# Altium project GR_carte_action27.PrjPcb
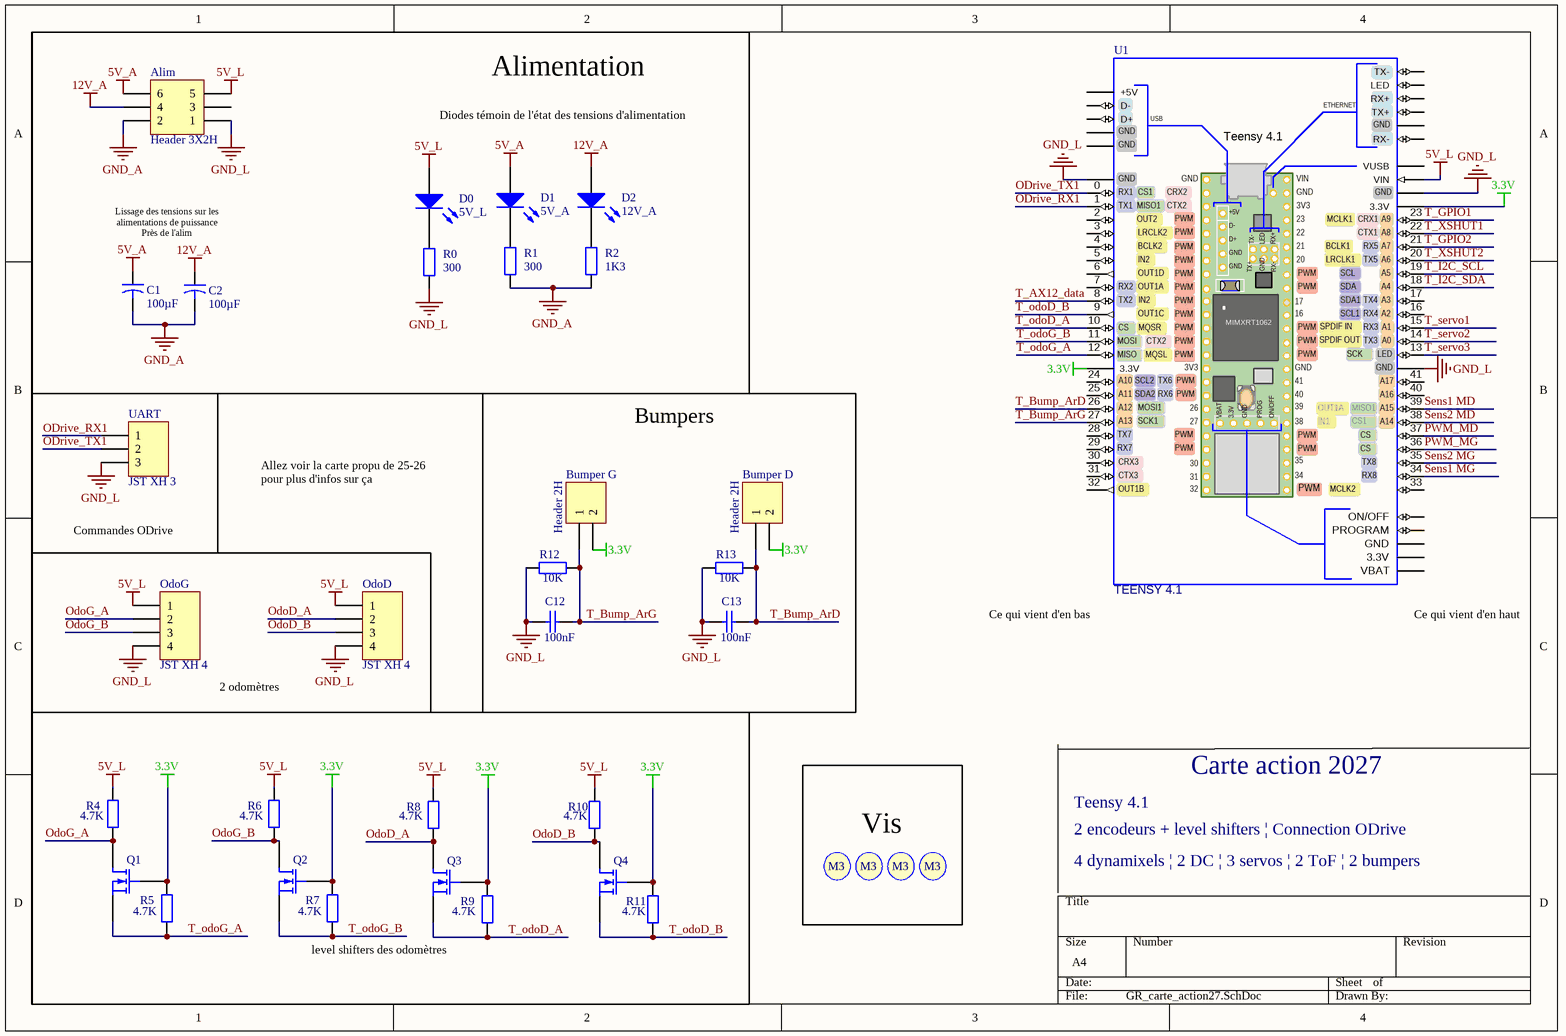
[diagram p0: GR_carte_action27.SchDoc]
2 sheets, 55 parts. Net scope: global (net labels, ports and power ports of the same name join across sheets).
Board files: GR_carte_action27.PcbDoc, GR_carte_action27v2.PcbDoc
Sheets:
  GR_carte_action27.SchDoc
  GR_carte_action_actionneurs27.SchDoc

## Sheet GR_carte_action27.SchDoc
size A4; SheetNumber: 1; SheetTotal: 2

### Parts
Alim  Header 3X2H  [MOLEX_MINIFITJR_3X2]
Bumper_D  Header 2H  [S2B-XH-A]
Bumper_G  Header 2H  [S2B-XH-A]
C1  value 100µF  [Condensateur]  (hidden comment: Cap2)
C2  value 100µF  [Condensateur]  (hidden comment: Cap2)
C12  value 100nF  [Capacitor 1206]  (hidden comment: Cap)
C13  value 100nF  [Capacitor 1206]  (hidden comment: Cap)
D0  5V_L  [KP-3216SEC]
D1  5V_A  [KP-3216SEC]
D2  12V_A  [KP-3216SEC]
OdoD  JST XH 4  [S4B-XH-A]
OdoG  JST XH 4  [S4B-XH-A]
Q1  MOSFET-N  [SOT23_M]  (value not drawn)
Q2  MOSFET-N  [SOT23_M]  (value not drawn)
Q3  MOSFET-N  [SOT23_M]  (value not drawn)
Q4  MOSFET-N  [SOT23_M]  (value not drawn)
R0  value 300  [Resistor 1206]  (hidden comment: Res2)
R1  value 300  [Resistor 1206]  (hidden comment: Res2)
R2  value 1K3  [Resistor 1206]  (hidden comment: Res2)
R4  value 4.7K  [Resistor 1206]  (hidden comment: Res2)
R5  value 4.7K  [Resistor 1206]  (hidden comment: Res2)
R6  value 4.7K  [Resistor 1206]  (hidden comment: Res2)
R7  value 4.7K  [Resistor 1206]  (hidden comment: Res2)
R8  value 4.7K  [Resistor 1206]  (hidden comment: Res2)
R9  value 4.7K  [Resistor 1206]  (hidden comment: Res2)
R10  value 4.7K  [Resistor 1206]  (hidden comment: Res2)
R11  value 4.7K  [Resistor 1206]  (hidden comment: Res2)
R12  value 10K  [Resistor 1206]  (hidden comment: Res2)
R13  value 10K  [Resistor 1206]  (hidden comment: Res2)
S0  Screw M3  [Screw M3]  (value not drawn)
S1  Screw M3  [Screw M3]  (value not drawn)
S2  Screw M3  [Screw M3]  (value not drawn)
S3  Screw M3  [Screw M3]  (value not drawn)
U1  value TEENSY 4.1  [Teensy_4.1]  (hidden comment: TEENSY_4.1)
UART  JST XH 3  [S3B-XH-A]

### Nets
3.3V: Bumper_D.2 Bumper_G.2 Q1.2(G) Q2.2(G) Q3.2(G) Q4.2(G) R5.2 R7.2 R9.2 R11.2 U1.3.3V_1(3.3V) U1.3.3V_2(3.3V)
5V_A: Alim.6 C1.1 D1.1(A)
5V_L: Alim.5 D0.1(A) OdoD.1 OdoG.1 R4.2 R6.2 R8.2 R10.2 U1.VIN
12V_A: Alim.4 C2.1 D2.1(A)
GND_A: Alim.2 C1.2 C2.2 R1.2 R2.2
GND_L: Alim.1 C12.1 C13.1 OdoD.4 OdoG.4 R0.1 R12.1 R13.1 U1.GND1(GND) U1.GND2(GND) U1.GND3(GND) UART.3
OdoD_A: OdoD.2 Q3.1(D) R8.1
OdoD_B: OdoD.3 Q4.1(D) R10.1
OdoG_A: OdoG.2 Q1.1(D) R4.1
OdoG_B: OdoG.3 Q2.1(D) R6.1
ODrive_RX1: U1.1(TX1) UART.1
ODrive_TX1: U1.0(RX1) UART.2
PWM_MD: U1.37(CS3)
PWM_MG: U1.36(CS2)
Sens1 MD: U1.39(A15)
Sens1 MG: U1.34(RX8)
Sens2 MD: U1.38(A14)
Sens2 MG: U1.35(TX8)
T_AX12_data: U1.8(TX2)
T_Bump_ArD: Bumper_D.1 C13.2 R13.2 U1.26(A12)
T_Bump_ArG: Bumper_G.1 C12.2 R12.2 U1.27(A13)
T_GPIO1: U1.23(A9)
T_GPIO2: U1.21(A7)
T_I2C_SCL: U1.19(A5)
T_I2C_SDA: U1.18(A4)
T_odoD_A: Q3.3(S) R9.1 U1.10(CS1)
T_odoD_B: Q4.3(S) R11.1 U1.9(OUT1C)
T_odoG_A: Q1.3(S) R5.1 U1.12(MISO)
T_odoG_B: Q2.3(S) R7.1 U1.11(MOSI)
T_servo1: U1.15(A1)
T_servo2: U1.14(A0)
T_servo3: U1.13(SCK)
T_XSHUT1: U1.22(A8)
T_XSHUT2: U1.20(A6)
NetD0_2: D0.2(K) R0.2
NetD1_2: D1.2(K) R1.1
NetD2_2: D2.2(K) R2.1

Not connected (* = marked no-connect by the designer): Alim 3; U1 2(OUT2) 3(LRCLK2) 3.3V_3(3.3V) 4(BCLK2) 5(IN2) 5V(+5V) 6(OUT1D) 7(RX2) 16(A2) 17(A3) 24(A10) 25(A11) 28(RX7) 29(TX7) 30(CRX3) 31(CTX3) 32(OUT1B) 33(MCLK2) 40(A16) 41(A17) D+ D- GND4(GND) GND5(GND) LED ON/OFF PROGRAM RX+ RX- TX+ TX- USB_GND1(USB_GND) USB_GND2(USB_GND) VBAT VUSB

### Notes on the sheet
- Alimentation
- Diodes témoin de l'état des tensions d'alimentation
- Lissage des tensions sur les alimentations de puissance
  Près de l'alim
- Bumpers
- Allez voir la carte propu de 25-26 pour plus d'infos sur ça
- Commandes ODrive
- (near U1) Ce qui vient d'en bas
- (near U1) Ce qui vient d'en haut
- 2 odomètres
- Carte action 2027
- Vis
- Teensy 4.1
- 2 encodeurs + level shifters | Connection ODrive
- 4 dynamixels | 2 DC | 3 servos | 2 ToF | 2 bumpers
- (near R7) level shifters des odomètres
- (in symbol Screw M3) M3
- (in symbol TEENSY_4.1) ETHERNET; USB; Teensy 4.1; CRX2; MISO1; CTX2; 3V3; PWM; MCLK1; CRX1; CTX1; BCLK1; RX5; LRCLK1; TX5; SCL; OUT1A; SDA; SDA1; TX4; SCL1; RX4; MIMXRT1062; CS; MQSR; SPDIF IN; RX3; SPDIF OUT; TX3; MQSL; SCL2; TX6; SDA2; RX6; MOSI1; PROG; SCK1; IN1

### Library data of the parts
Alim = Header 3X2H: Header, 3-Pin, Dual row, Right Angle; LatestRevisionDate: 17-Jul-2002; LatestRevisionNote: Re-released for DXP Platform.; Publisher: Altium Limited
Bumper_D Bumper_G = Header 2H: Header, 2-Pin, Right Angle; LatestRevisionDate: 17-Jul-2002; LatestRevisionNote: Re-released for DXP Platform.; Publisher: Altium Limited
C1 C2 = Cap2: Capacitor; Published: 23-Sep-2002; PackageReference: CAPR5-4X5; Publisher: Altium Limited; PackageDescription: Capacitor; 2 Leads
C12 C13 = Cap: Capacitor; Published: 8-Jun-2000; LatestRevisionDate: 17-Jul-2002; LatestRevisionNote: Re-released for DXP Platform.; PackageReference: RAD-0.3; Publisher: Altium Limited; PackageDescription: Radial Cap, Thru-Hole; 2 Leads; 0.3 in Pin Spacing
D0-D2 = LED2: Typical RED, GREEN, YELLOW, AMBER GaAs LED; Published: 8-Jun-2000; LatestRevisionDate: 17-Jul-2002; LatestRevisionNote: Re-released for DXP Platform.; PackageVersion: Feb-2002; PackageReference: 3.2X1.6X1.1; Publisher: Altium Limited; PackageDescription: SM LED; 2 Flat Leads
OdoD OdoG = Header 4H: Molex SPOX 4x1H; LatestRevisionDate: 17-Jul-2002; LatestRevisionNote: Re-released for DXP Platform.; Publisher: Altium Limited
Q1-Q4 = MOSFET-N: N-Channel MOSFET; pin to pad: 2>3 3>2; Published: 8-Jun-2000; LatestRevisionDate: 17-Jul-2002; LatestRevisionNote: Re-released for DXP Platform.; PackageVersion: 1995/1996; PackageReference: E3; Publisher: Altium Limited; PackageDescription: TO, Flat Index; 3 In-Line, Axial Leads; Body Dia. 4.6mm; Lead Dia. 0.5 mm (max)
R0-R2 R4-R13 = Res2: Resistor; Published: 8-Jun-2000; LatestRevisionDate: 17-Jul-2002; LatestRevisionNote: Re-released for DXP Platform.; PackageReference: AXIAL-0.4; Publisher: Altium Limited; PackageDescription: Axial Device, Thru-Hole; 2 Leads; 0.4 in Pin Spacing
U1 = TEENSY_4.1: RT1062 Teensy 4.1 w/ Headers RT1062 600 MHZ; Manufacturer: PJRC; Manufacturer_Part_Number: DEV-16996; ComponentLink1Description: pin_function_front; ComponentLink1URL: https://www.pjrc.com/teensy/card11a_rev4_web.pdf; ComponentLink2Description: pin_function_back; ComponentLink2URL: https://www.pjrc.com/teensy/card11b_rev4_web.pdf; ComponentLink3Description: Digikey; ComponentLink3URL: https://www.digikey.com/en/products/detail/sparkfun-electronics/16996/13158152; ComponentLink4Description: Datasheet; ComponentLink4URL: https://mm.digikey.com/Volume0/opasdata/d220001/medias/docus/2942/DEV-16996_Web.pdf
UART = Header 3H: Header, 3-Pin, Right Angle; LatestRevisionDate: 17-Jul-2002; LatestRevisionNote: Re-released for DXP Platform.; Publisher: Altium Limited

## Sheet GR_carte_action_actionneurs27.SchDoc
size A4; SheetNumber: 2; SheetTotal: 2
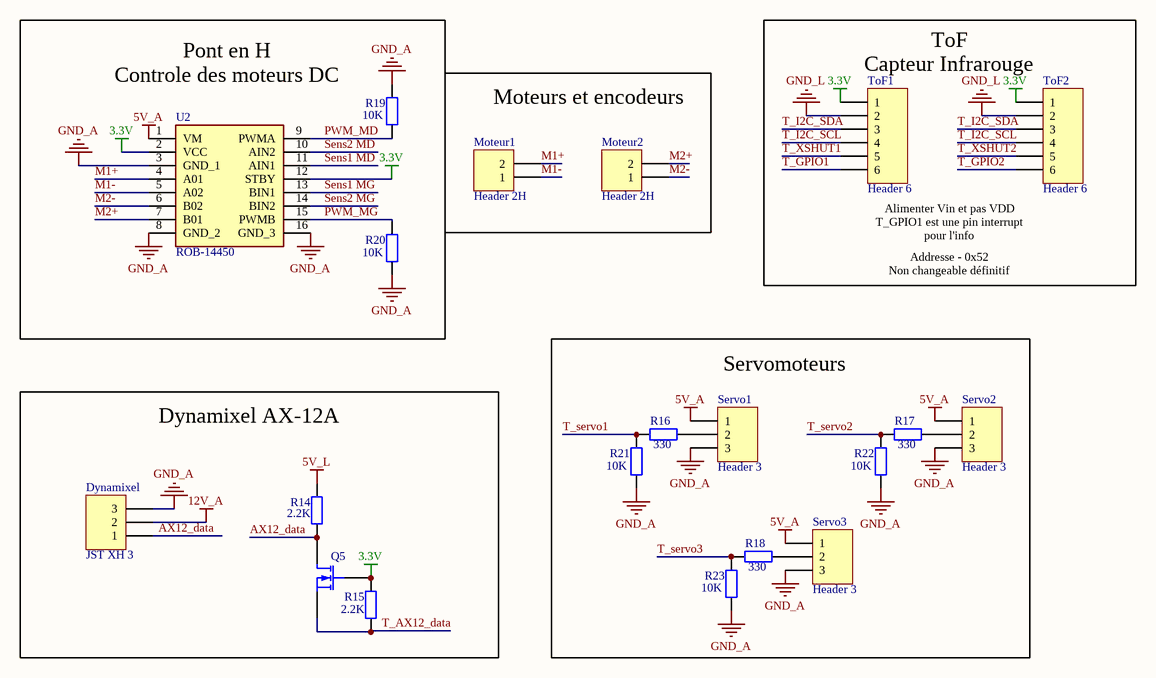
[diagram p1: GR_carte_action_actionneurs27.SchDoc]

### Parts
Dynamixel  JST XH 3  [S3B-XH-A]
Moteur1  Header 2H  [JST XH B2B-XH-A]
Moteur2  Header 2H  [JST XH B2B-XH-A]
Q5  MOSFET-N  [SOT23_M]  (value not drawn)
R14  value 2.2K  [Resistor 1206]  (hidden comment: Res2)
R15  value 2.2K  [Resistor 1206]  (hidden comment: Res2)
R16  value 330  [Resistor 1206]  (hidden comment: Res2)
R17  value 330  [Resistor 1206]  (hidden comment: Res2)
R18  value 330  [Resistor 1206]  (hidden comment: Res2)
R19  value 10K  [Resistor 1206]  (hidden comment: Res2)
R20  value 10K  [Resistor 1206]  (hidden comment: Res2)
R21  value 10K  [Resistor 1206]  (hidden comment: Res2)
R22  value 10K  [Resistor 1206]  (hidden comment: Res2)
R23  value 10K  [Resistor 1206]  (hidden comment: Res2)
Servo1  Header 3  [JST XH B3B-XH-A]
Servo2  Header 3  [JST XH B3B-XH-A]
Servo3  Header 3  [JST XH B3B-XH-A]
ToF1  Header 6  [JST XH B6B-XH-A]
ToF2  Header 6  [JST XH B6B-XH-A]
U2  ROB-14450  [ROB14450]

### Blocks framed on the sheet
Moteurs et encodeurs: Moteur1 Moteur2
Dynamixel AX-12A: Dynamixel Q5 R14 R15

### Nets
3.3V: Q5.2(G) R15.2 ToF1.1 ToF2.1 U2.2(VCC) U2.12(STBY)
5V_A: Servo1.1 Servo2.1 Servo3.1 U2.1(VM)
5V_L: R14.2
12V_A: Dynamixel.2
GND_A: Dynamixel.3 R19.2 R20.1 R21.1 R22.1 R23.1 Servo1.3 Servo2.3 Servo3.3 U2.3(GND_1) U2.8(GND_2) U2.16(GND_3)
GND_L: ToF1.2 ToF2.2
AX12_data: Dynamixel.1 Q5.1(D) R14.1
M1+: Moteur1.2 U2.4(A01)
M1-: Moteur1.1 U2.5(A02)
M2+: Moteur2.2 U2.7(B01)
M2-: Moteur2.1 U2.6(B02)
PWM_MD: R19.1 U2.9(PWMA)
PWM_MG: R20.2 U2.15(PWMB)
Sens1 MD: U2.11(AIN1)
Sens1 MG: U2.13(BIN1)
Sens2 MD: U2.10(AIN2)
Sens2 MG: U2.14(BIN2)
T_AX12_data: Q5.3(S) R15.1
T_GPIO1: ToF1.6
T_GPIO2: ToF2.6
T_I2C_SCL: ToF1.4 ToF2.4
T_I2C_SDA: ToF1.3 ToF2.3
T_servo1: R16.1 R21.2
T_servo2: R17.1 R22.2
T_servo3: R18.1 R23.2
T_XSHUT1: ToF1.5
T_XSHUT2: ToF2.5
NetR16_2: R16.2 Servo1.2
NetR17_2: R17.2 Servo2.2
NetR18_2: R18.2 Servo3.2

### Notes on the sheet
- Pont en H
  Controle des moteurs DC
- ToF
  Capteur Infrarouge
- Alimenter Vin et pas VDD
  T_GPIO1 est une pin interrupt pour l'info
- Addresse - 0x52
  Non changeable définitif
- Servomoteurs

### Library data of the parts
Dynamixel = Header 3H: Header, 3-Pin, Right Angle; LatestRevisionDate: 17-Jul-2002; LatestRevisionNote: Re-released for DXP Platform.; Publisher: Altium Limited
Moteur1 Moteur2 = Header 2H: Header, 2-Pin, Right Angle; LatestRevisionDate: 17-Jul-2002; LatestRevisionNote: Re-released for DXP Platform.; Publisher: Altium Limited
Q5 = MOSFET-N: N-Channel MOSFET; pin to pad: 2>3 3>2; Published: 8-Jun-2000; LatestRevisionDate: 17-Jul-2002; LatestRevisionNote: Re-released for DXP Platform.; PackageVersion: 1995/1996; PackageReference: E3; Publisher: Altium Limited; PackageDescription: TO, Flat Index; 3 In-Line, Axial Leads; Body Dia. 4.6mm; Lead Dia. 0.5 mm (max)
R14-R23 = Res2: Resistor; Published: 8-Jun-2000; LatestRevisionDate: 17-Jul-2002; LatestRevisionNote: Re-released for DXP Platform.; PackageReference: AXIAL-0.4; Publisher: Altium Limited; PackageDescription: Axial Device, Thru-Hole; 2 Leads; 0.4 in Pin Spacing
Servo1-Servo3 = Header 3: Header, 3-Pin; LatestRevisionDate: 17-Jul-2002; LatestRevisionNote: Re-released for DXP Platform.; Publisher: Altium Limited
ToF1 ToF2 = Header 6: Header, 6-Pin; LatestRevisionDate: 17-Jul-2002; LatestRevisionNote: Re-released for DXP Platform.; Publisher: Altium Limited
U2 = ROB-14450: Undefined or Miscellaneous; Manufacturer_Name: SparkFun; Datasheet Link: https://www.sparkfun.com/products/14450; Height: 5mm; Manufacturer_Part_Number: ROB-14450; Mouser Part Number: 474-ROB-14450; Mouser Price/Stock: https://www.mouser.co.uk/ProductDetail/SparkFun/ROB-14450?qs=wd5RIQLrsJhQdlH%2FW5H2aQ%3D%3D; Arrow Part Number: ROB-14450; Arrow Price/Stock: https://www.arrow.com/en/products/rob-14450/sparkfun-electronics?region=nac

## Nets that join several sheets
3.3V: GR_carte_action27 (12 pins), GR_carte_action_actionneurs27 (6 pins)
5V_A: GR_carte_action27 (Alim.6 C1.1 D1.1), GR_carte_action_actionneurs27 (Servo1.1 Servo2.1 Servo3.1 U2.1)
5V_L: GR_carte_action27 (9 pins), GR_carte_action_actionneurs27 (R14.2)
12V_A: GR_carte_action27 (Alim.4 C2.1 D2.1), GR_carte_action_actionneurs27 (Dynamixel.2)
GND_A: GR_carte_action27 (5 pins), GR_carte_action_actionneurs27 (12 pins)
GND_L: GR_carte_action27 (12 pins), GR_carte_action_actionneurs27 (ToF1.2 ToF2.2)
PWM_MD: GR_carte_action27 (U1.37), GR_carte_action_actionneurs27 (R19.1 U2.9)
PWM_MG: GR_carte_action27 (U1.36), GR_carte_action_actionneurs27 (R20.2 U2.15)
Sens1 MD: GR_carte_action27 (U1.39), GR_carte_action_actionneurs27 (U2.11)
Sens1 MG: GR_carte_action27 (U1.34), GR_carte_action_actionneurs27 (U2.13)
Sens2 MD: GR_carte_action27 (U1.38), GR_carte_action_actionneurs27 (U2.10)
Sens2 MG: GR_carte_action27 (U1.35), GR_carte_action_actionneurs27 (U2.14)
T_AX12_data: GR_carte_action27 (U1.8), GR_carte_action_actionneurs27 (Q5.3 R15.1)
T_GPIO1: GR_carte_action27 (U1.23), GR_carte_action_actionneurs27 (ToF1.6)
T_GPIO2: GR_carte_action27 (U1.21), GR_carte_action_actionneurs27 (ToF2.6)
T_I2C_SCL: GR_carte_action27 (U1.19), GR_carte_action_actionneurs27 (ToF1.4 ToF2.4)
T_I2C_SDA: GR_carte_action27 (U1.18), GR_carte_action_actionneurs27 (ToF1.3 ToF2.3)
T_servo1: GR_carte_action27 (U1.15), GR_carte_action_actionneurs27 (R16.1 R21.2)
T_servo2: GR_carte_action27 (U1.14), GR_carte_action_actionneurs27 (R17.1 R22.2)
T_servo3: GR_carte_action27 (U1.13), GR_carte_action_actionneurs27 (R18.1 R23.2)
T_XSHUT1: GR_carte_action27 (U1.22), GR_carte_action_actionneurs27 (ToF1.5)
T_XSHUT2: GR_carte_action27 (U1.20), GR_carte_action_actionneurs27 (ToF2.5)